# EAGLE schematic RK628H-2x22P-RevA (EAGLE 9.7.0)

## Sheet 1 of 6: Title Page
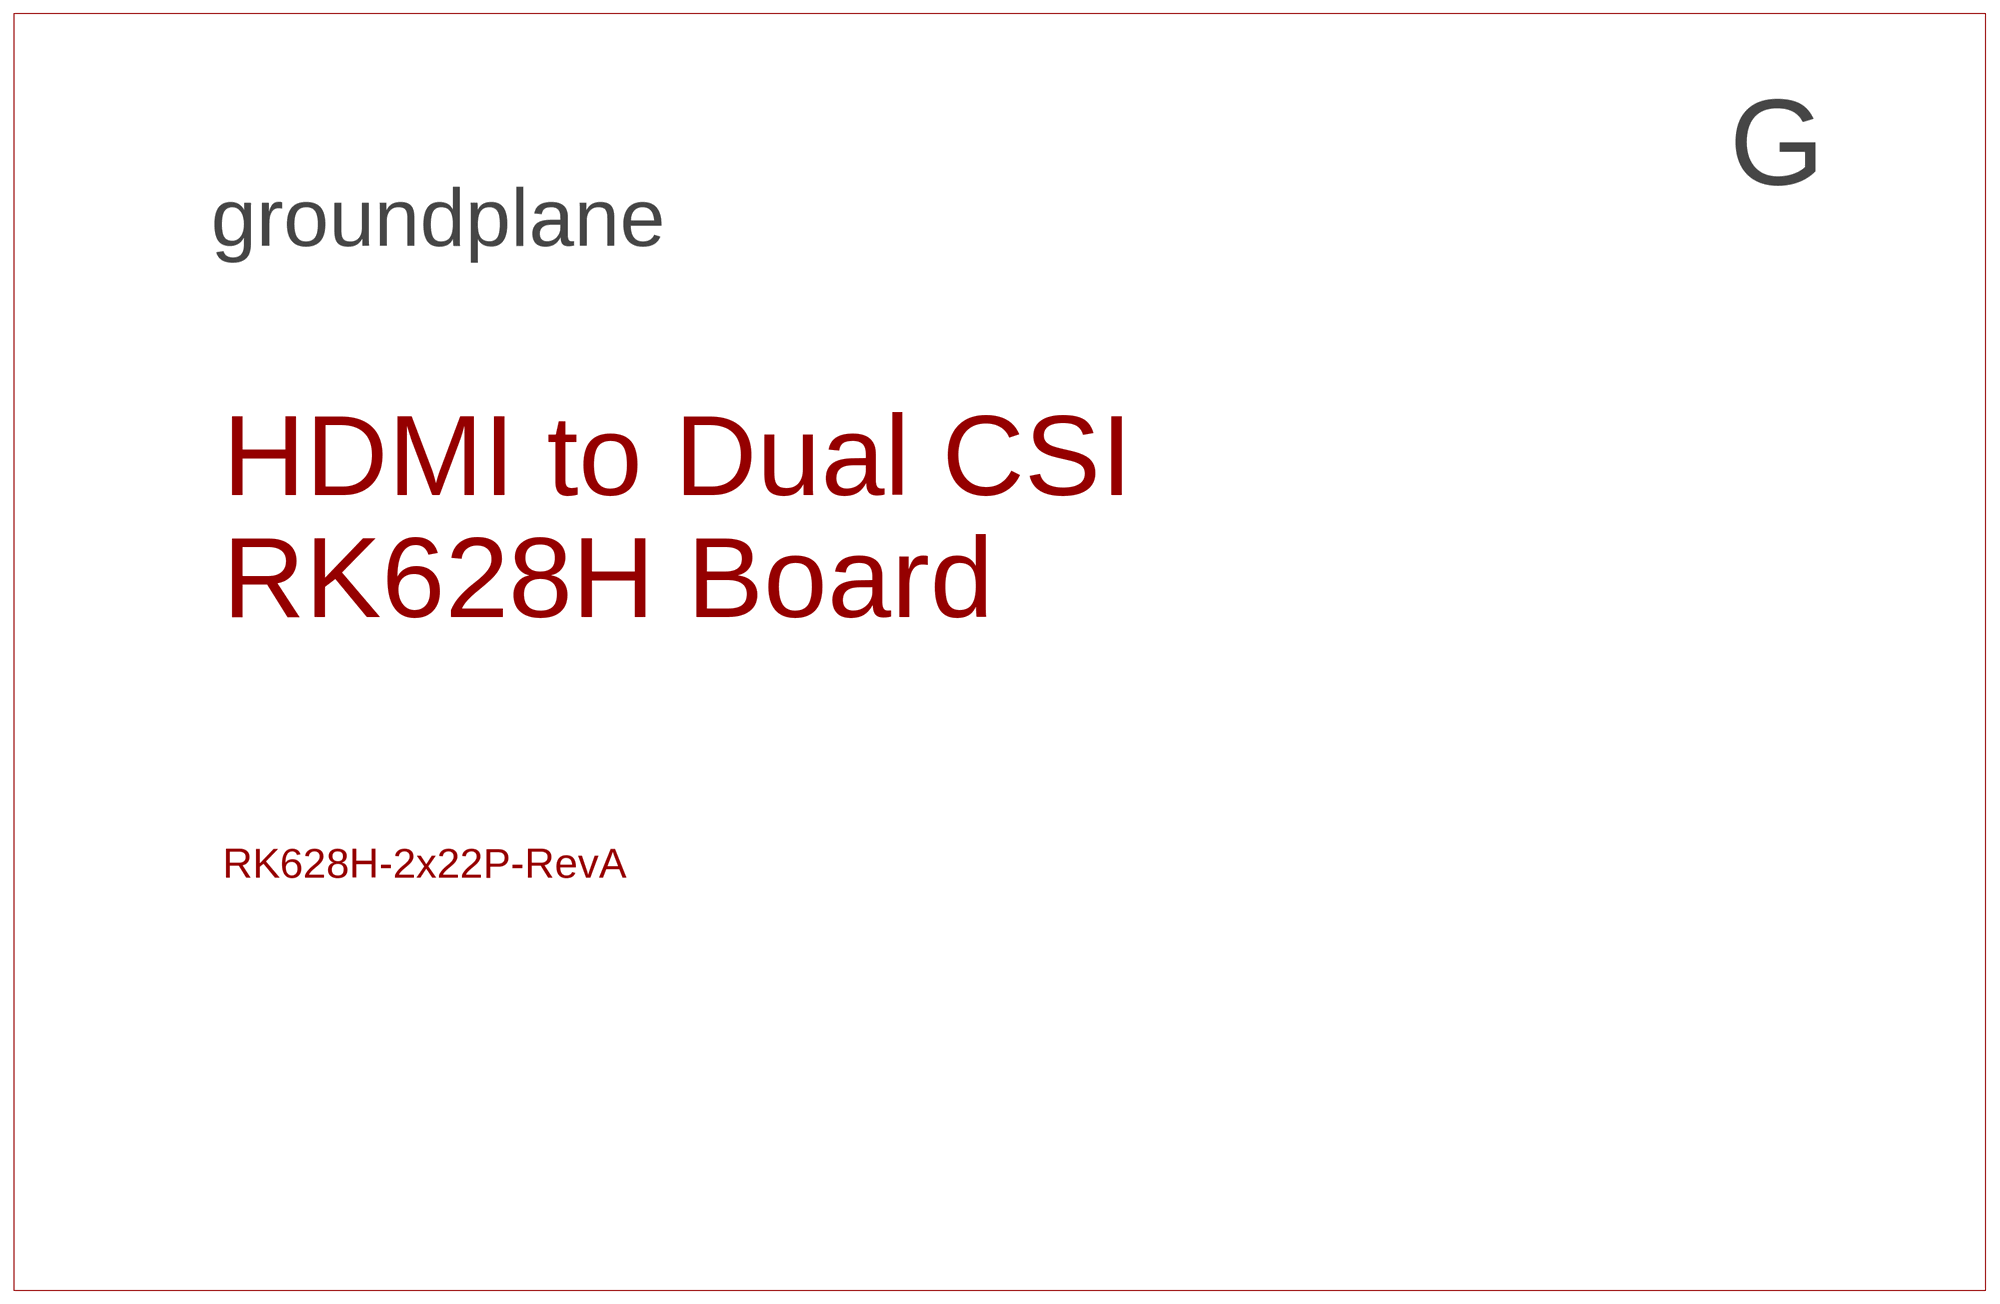
[diagram p0: schematic, sheet 1]

### Notes on the sheet
- HDMI to Dual CSI
  RK628H Board

## Sheet 2 of 6: Table of Contents
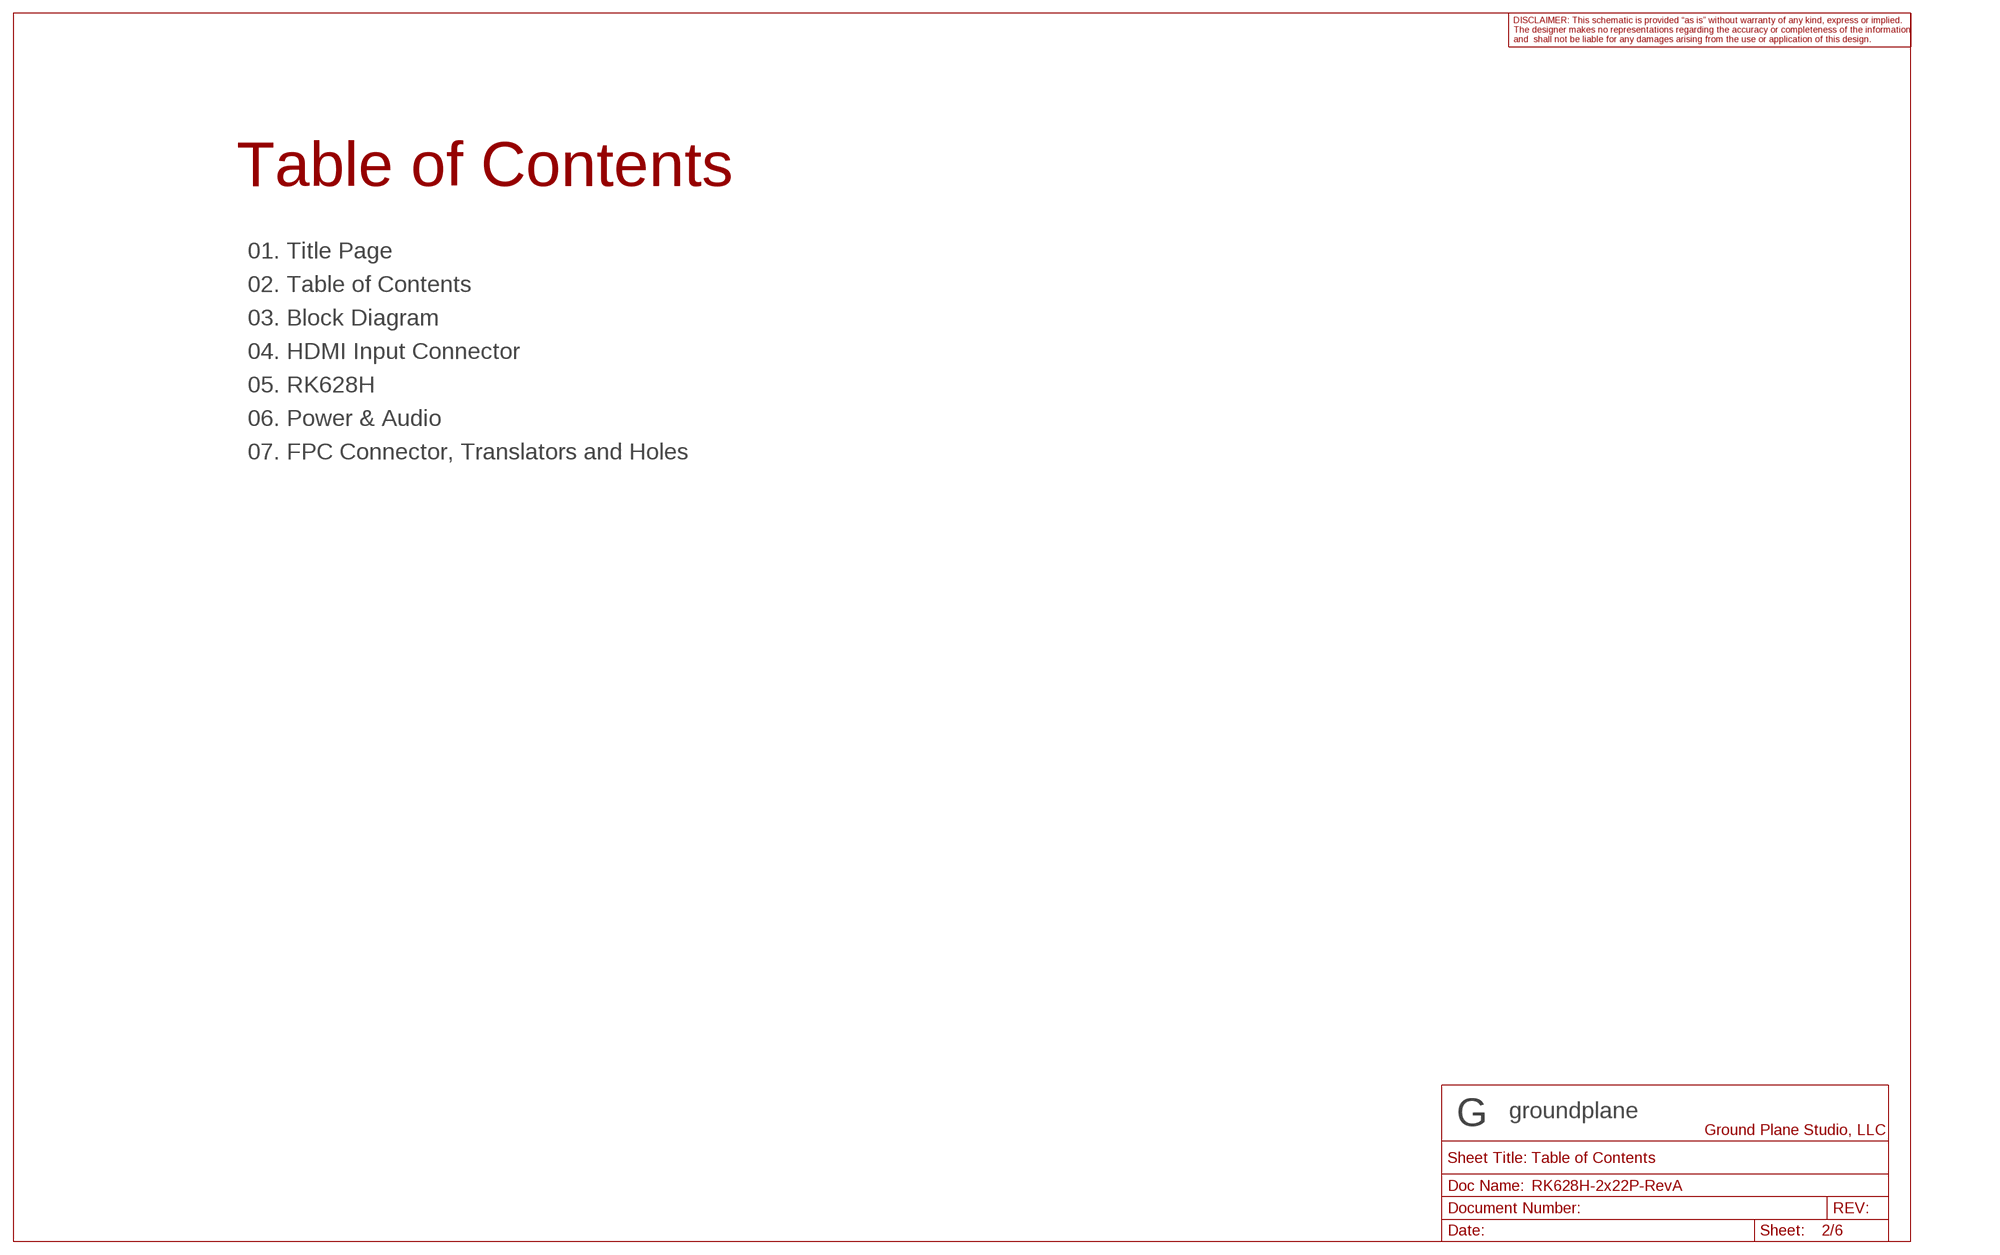
[diagram p1: schematic, sheet 2]

### Notes on the sheet
- 01. Title Page
- 02. Table of Contents
- 03. Block Diagram
- 04. HDMI Input Connector
- 05. RK628H
- 06. Power & Audio
- 07. FPC Connector, Translators and Holes

## Sheet 3 of 6: Block Diagram
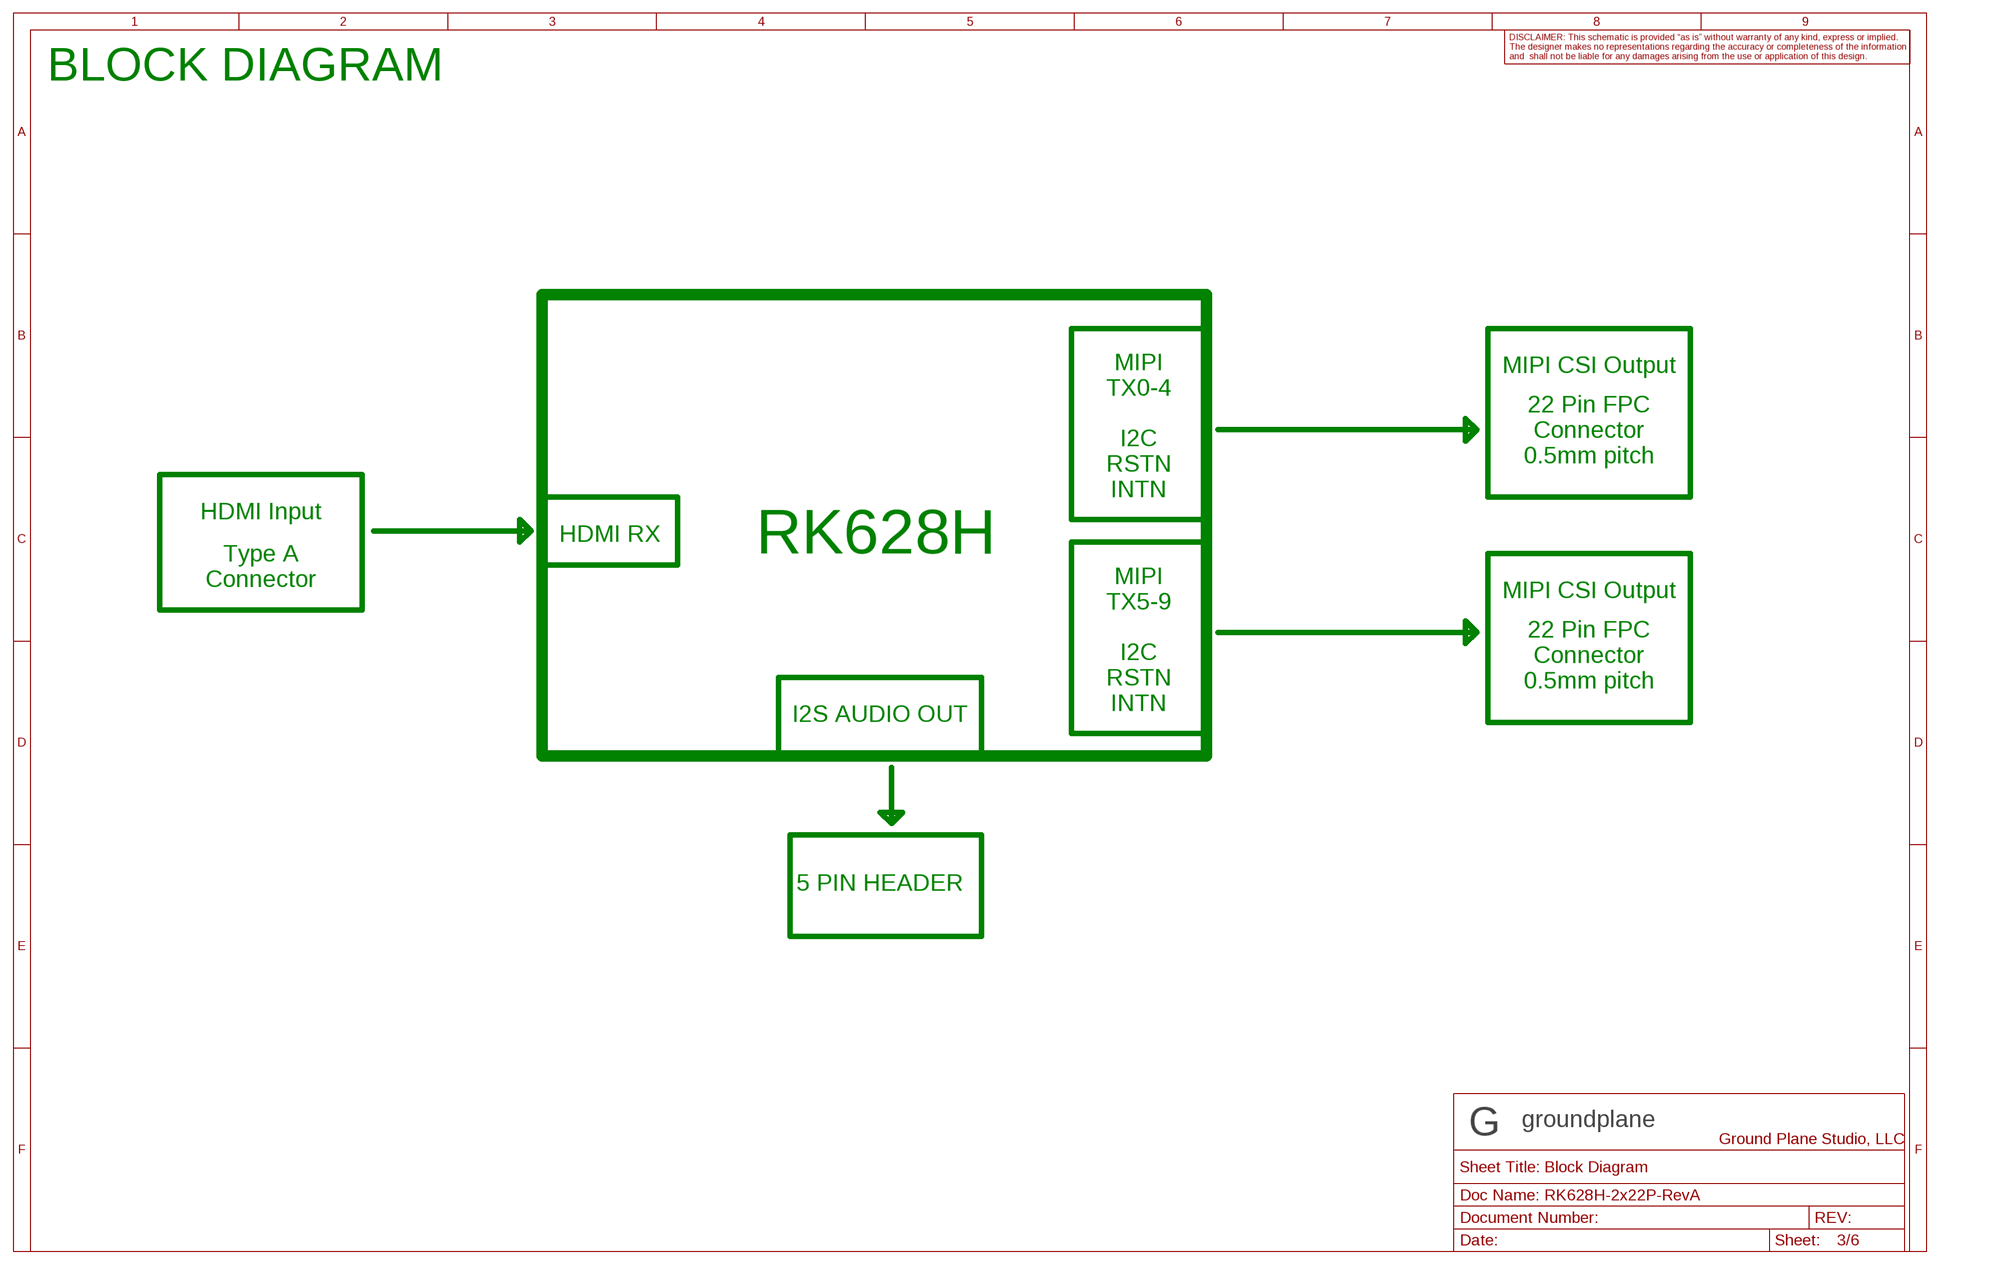
[diagram p2: schematic, sheet 3]

### Notes on the sheet
- BLOCK DIAGRAM
- MIPI CSI Output
- MIPI
  TX0-4
- 22 Pin FPC
  Connector
  0.5mm pitch
- I2C
  RSTN
  INTN
- HDMI Input
- HDMI RX
- RK628H
- Type A
  Connector
- MIPI CSI Output
- MIPI
  TX5-9
- 22 Pin FPC
  Connector
  0.5mm pitch
- I2C
  RSTN
  INTN
- I2S AUDIO OUT
- 5 PIN HEADER

## Sheet 4 of 6: HDMI Input Connector/TVS/Filters
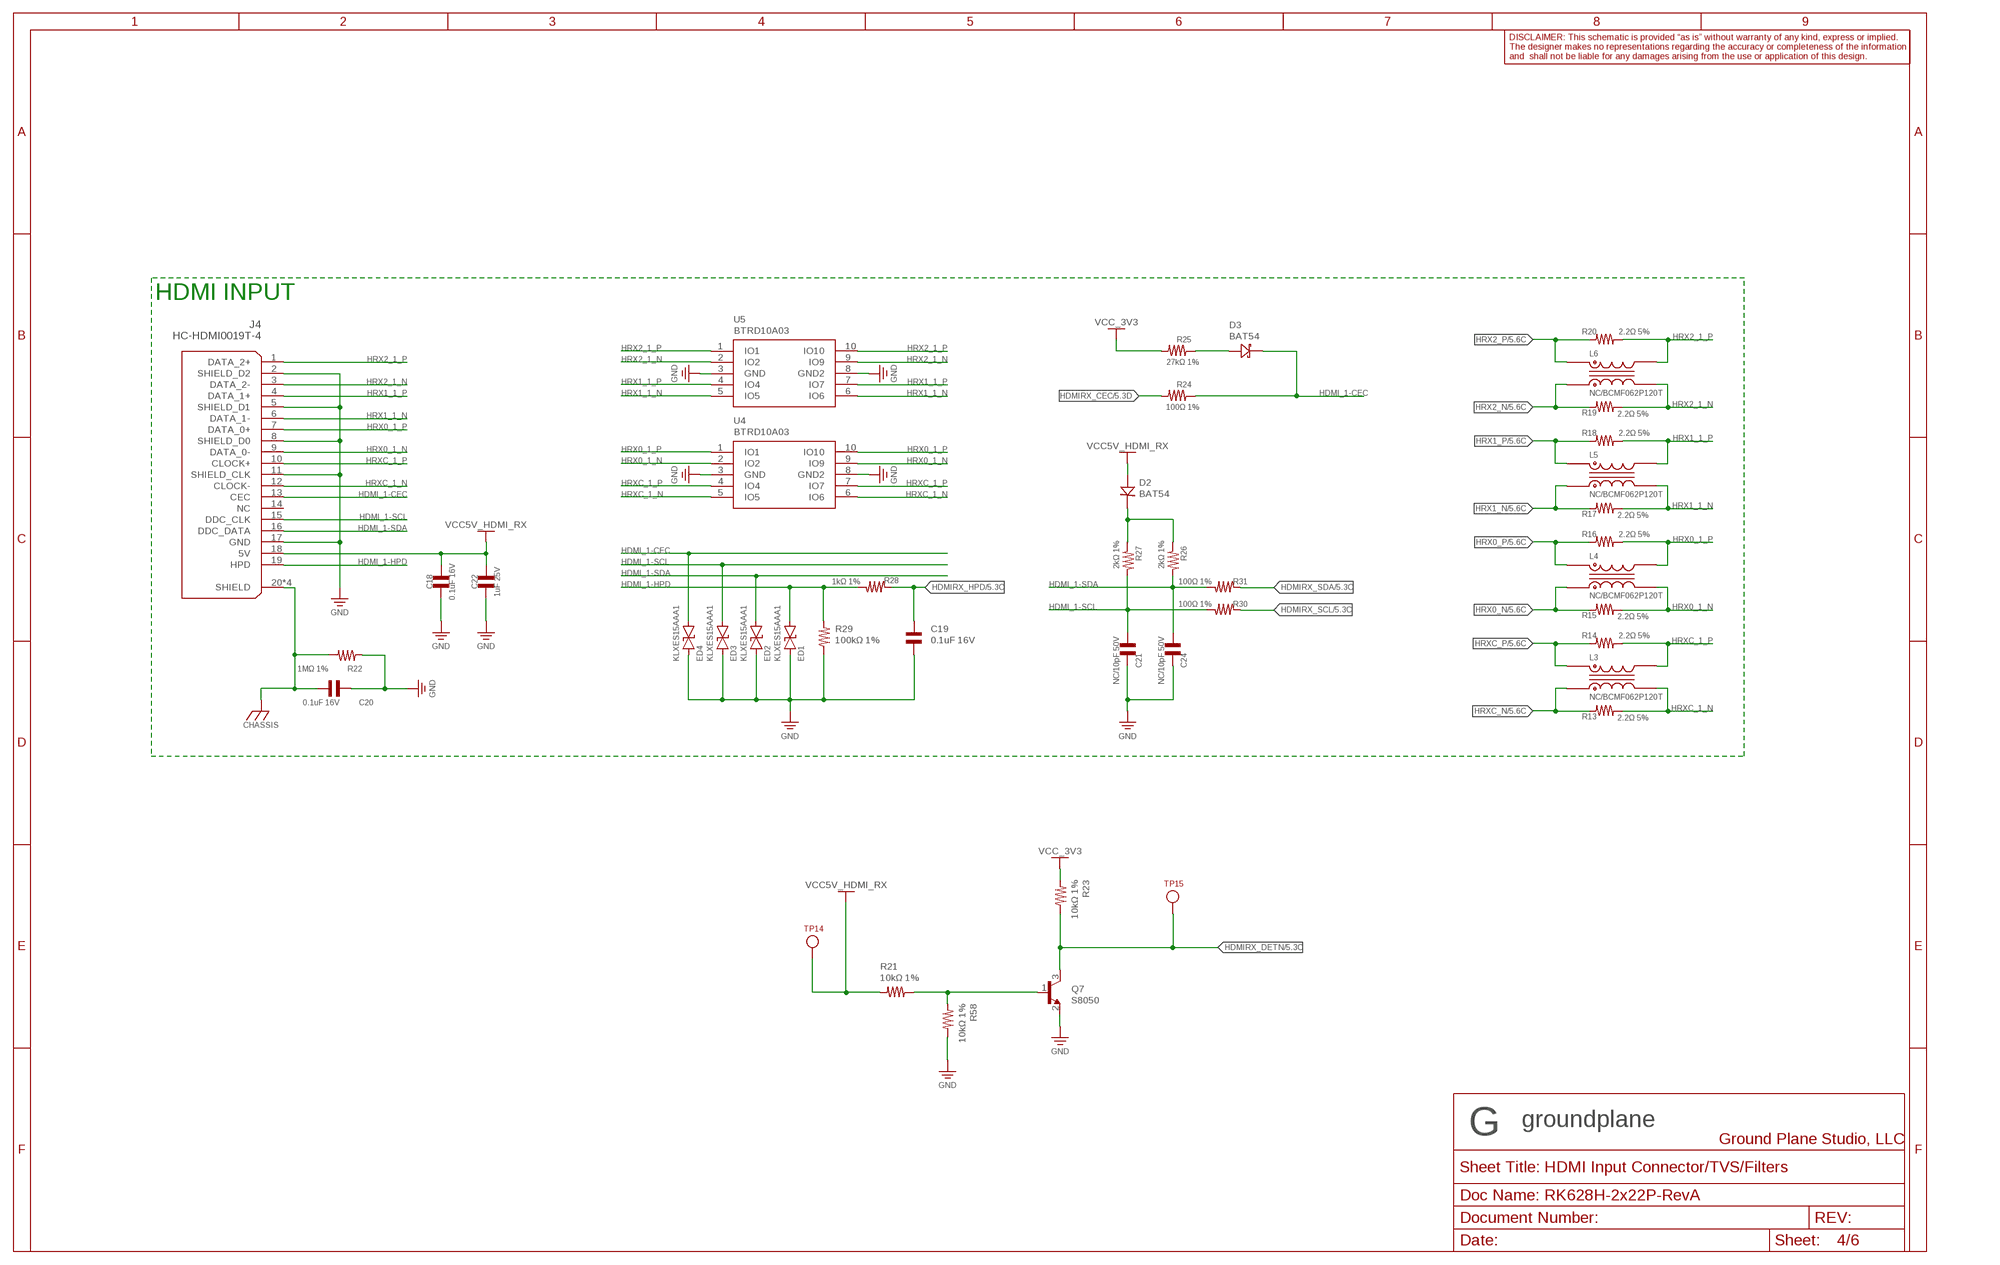
[diagram p3: schematic, sheet 4]

### Parts
C18  0.1uF 16V  CAP_0402_0.1UF_16V_X7R  [CAP_0402]
C19  0.1uF 16V  CAP_0402_0.1UF_16V_X7R  [CAP_0402]
C20  0.1uF 16V  CAP_0402_0.1UF_16V_X7R  [CAP_0402]
C21  NC/10pF 50V  CAP_0201_DNP_10PF_50V  [CAP_0201]
C22  1uF 25V  CAP_0402_1UF_25V_X5R  [CAP_0402]
C24  NC/10pF 50V  CAP_0201_DNP_10PF_50V  [CAP_0201]
D2  BAT54  DIODE_SCHOTTKY_BAT54  [SOT-23-3]
D3  BAT54  DIODE_SCHOTTKY_BAT54  [SOT-23-3]
ED1  KLXES15AAA1  TVS_ESD_1CH_BI_KLXES15AAA1  [TVS_0402]
ED2  KLXES15AAA1  TVS_ESD_1CH_BI_KLXES15AAA1  [TVS_0402]
ED3  KLXES15AAA1  TVS_ESD_1CH_BI_KLXES15AAA1  [TVS_0402]
ED4  KLXES15AAA1  TVS_ESD_1CH_BI_KLXES15AAA1  [TVS_0402]
J4  HC-HDMI0019T-4  CONN_HDMI_A_HC-HDMI0019T-4  [CONN_HDMI_A_SMT_RA_HC-HDMI0019T-4]
L3  NC/BCMF062P120T  BCMF062P120T_BCMF062P120T_NC  [BCMF062P120T]
L4  NC/BCMF062P120T  BCMF062P120T_BCMF062P120T_NC  [BCMF062P120T]
L5  NC/BCMF062P120T  BCMF062P120T_BCMF062P120T_NC  [BCMF062P120T]
L6  NC/BCMF062P120T  BCMF062P120T_BCMF062P120T_NC  [BCMF062P120T]
Q7  S8050  NPN_S8050  [SOT-23-3]
R13  2.2Ω 5%  RES_0201_2R2_5%  [RES_0201]
R14  2.2Ω 5%  RES_0201_2R2_5%  [RES_0201]
R15  2.2Ω 5%  RES_0201_2R2_5%  [RES_0201]
R16  2.2Ω 5%  RES_0201_2R2_5%  [RES_0201]
R17  2.2Ω 5%  RES_0201_2R2_5%  [RES_0201]
R18  2.2Ω 5%  RES_0201_2R2_5%  [RES_0201]
R19  2.2Ω 5%  RES_0201_2R2_5%  [RES_0201]
R20  2.2Ω 5%  RES_0201_2R2_5%  [RES_0201]
R21  10kΩ 1%  RES_0402_10K_1%_1/16W  [RES_0402]
R22  1MΩ 1%  RES_0402_1M_1%  [RES_0402]
R23  10kΩ 1%  RES_0402_10K_1%_1/16W  [RES_0402]
R24  100Ω 1%  RES_0402_100R_1%  [RES_0402]
R25  27kΩ 1%  RES_0402_27K_1%  [RES_0402]
R26  2kΩ 1%  RES_0402_2K_1%_1/16W  [RES_0402]
R27  2kΩ 1%  RES_0402_2K_1%_1/16W  [RES_0402]
R28  1kΩ 1%  RES_0402_1K_1%  [RES_0402]
R29  100kΩ 1%  RES_0402_100K_1%_1/16W  [RES_0402]
R30  100Ω 1%  RES_0402_100R_1%  [RES_0402]
R31  100Ω 1%  RES_0402_100R_1%  [RES_0402]
R58  10kΩ 1%  RES_0402_10K_1%_1/16W  [RES_0402]
TP14  TEST_POINT_1MM_0.5MM  TESTPOINT_1MM  [TEST_POINT_1MM]
TP15  TEST_POINT_1MM_0.5MM  TESTPOINT_1MM  [TEST_POINT_1MM]
U4  BTRD10A03  TVS_ESD_4CH_10P_PASS_THRU_BTRD10A03  [DFN2510-10]
U5  BTRD10A03  TVS_ESD_4CH_10P_PASS_THRU_BTRD10A03  [DFN2510-10]

### Nets
CGND: C20.2 J4.20(SHIELD) J4.21(SHIELD) J4.22(SHIELD) J4.23(SHIELD) R22.1 ; supply symbol labelled CHASSIS ; also sheet 6
GND: C18.1 C19.1 C20.1 C21.1 C22.1 C24.1 ED1.1 ED2.1 ED3.1 ED4.1 J4.2(SHIELD_D2) J4.5(SHIELD_D1) J4.8(SHIELD_D0) J4.11(SHIELD_CLK) J4.17(GND) Q7.2(E) R22.2 R29.1 R58.1 U4.3(GND) U4.8(GND2) U5.3(GND) U5.8(GND2) ; also sheet 5,6
HDMI_1-CEC: D3.3(C) ED4.2 J4.13(CEC) R24.1
HDMI_1-HPD: ED1.2 J4.19(HPD) R28.1 R29.2
HDMI_1-SCL: C21.2 ED3.2 J4.15(DDC_CLK) R27.2 R30.1
HDMI_1-SDA: C24.2 ED2.2 J4.16(DDC_DATA) R26.2 R31.1
HDMIRX_CEC [50 ohm]: R24.2 ; also sheet 5
HDMIRX_DETN: Q7.3(C) R23.1 TP15.P$1 ; also sheet 5,6
HDMIRX_HPD: C19.2 R28.2 ; also sheet 5
HDMIRX_SCL [50 ohm]: R30.2 ; also sheet 5
HDMIRX_SDA [50 ohm]: R31.2 ; also sheet 5
HRX0_1_N [hdmi_diff]: J4.9(DATA_0-) L4.3 R15.1 U4.2(IO2) U4.9(IO9)
HRX0_1_P [hdmi_diff]: J4.7(DATA_0+) L4.4 R16.1 U4.1(IO1) U4.10(IO10)
HRX0_N [hdmi_diff]: L4.2 R15.2 ; also sheet 5
HRX0_P [hdmi_diff]: L4.1 R16.2 ; also sheet 5
HRX1_1_N [hdmi_diff]: J4.6(DATA_1-) L5.3 R17.1 U5.5(IO5) U5.6(IO6)
HRX1_1_P [hdmi_diff]: J4.4(DATA_1+) L5.4 R18.1 U5.4(IO4) U5.7(IO7)
HRX1_N [hdmi_diff]: L5.2 R17.2 ; also sheet 5
HRX1_P [hdmi_diff]: L5.1 R18.2 ; also sheet 5
HRX2_1_N [hdmi_diff]: J4.3(DATA_2-) L6.3 R19.1 U5.2(IO2) U5.9(IO9)
HRX2_1_P [hdmi_diff]: J4.1(DATA_2+) L6.4 R20.1 U5.1(IO1) U5.10(IO10)
HRX2_N [hdmi_diff]: L6.2 R19.2 ; also sheet 5
HRX2_P [hdmi_diff]: L6.1 R20.2 ; also sheet 5
HRXC_1_N [hdmi_diff]: J4.12(CLOCK-) L3.3 R13.1 U4.5(IO5) U4.6(IO6)
HRXC_1_P [hdmi_diff]: J4.10(CLOCK+) L3.4 R14.1 U4.4(IO4) U4.7(IO7)
HRXC_N [hdmi_diff]: L3.2 R13.2 ; also sheet 5
HRXC_P [hdmi_diff]: L3.1 R14.2 ; also sheet 5
N$1: D2.3(C) R26.1 R27.1
N$11: D3.1(A) R25.1
N$44: Q7.1(B) R21.1 R58.2
VCC5V_HDMI_RX: C18.2 C22.2 D2.1(A) J4.18(5V) R21.2 TP14.P$1
VCC_3V3: R23.2 R25.2 ; also sheet 5,6
Unconnected: J4.14(NC)

### Notes on the sheet
- HDMI INPUT

## Sheet 5 of 6: HDMI TO CSI - RK628H
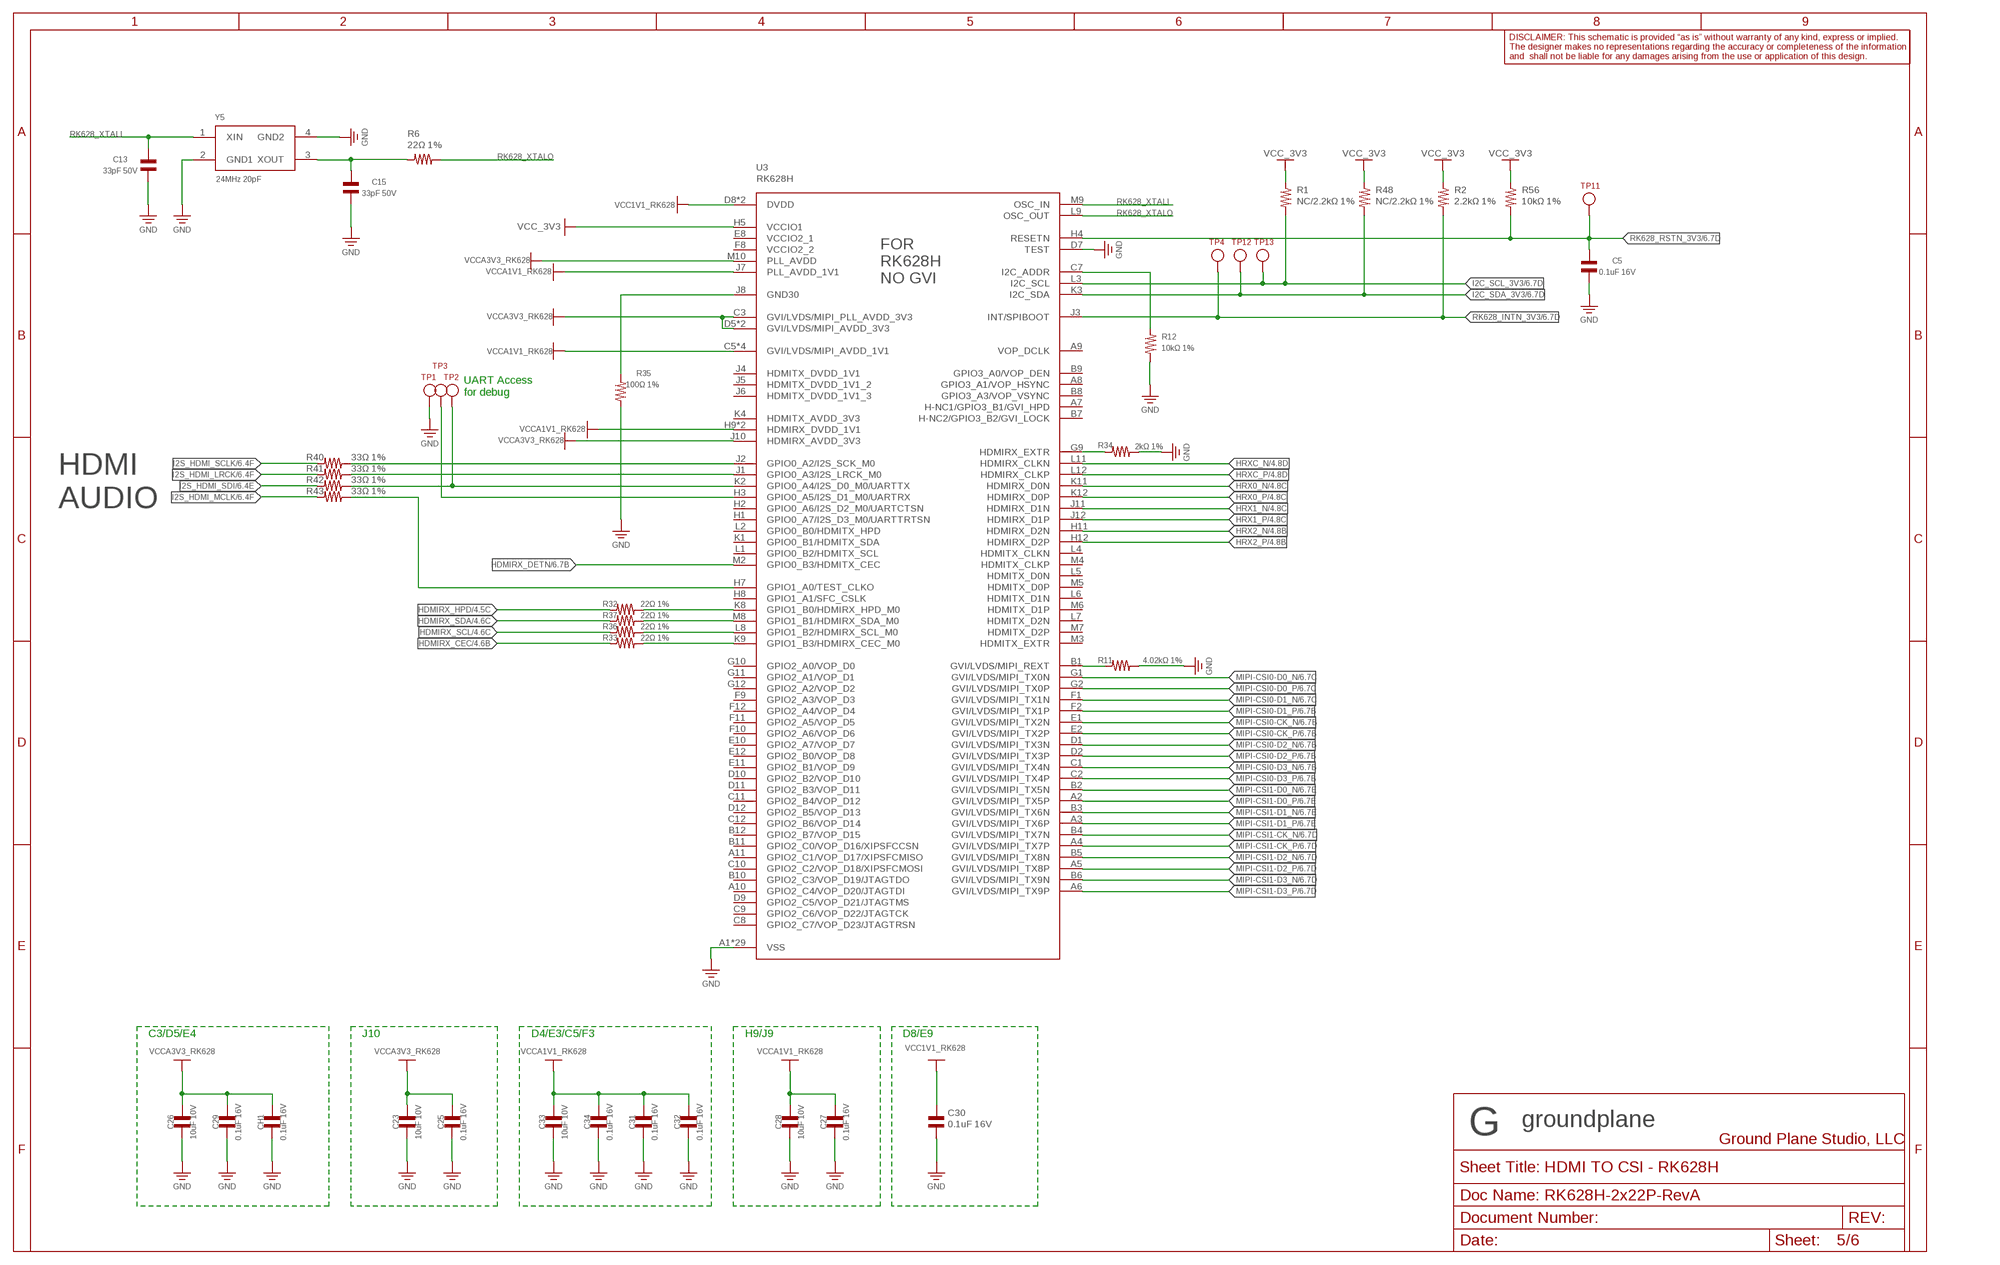
[diagram p4: schematic, sheet 5]

### Parts
C5  0.1uF 16V  CAP_0402_0.1UF_16V_X7R  [CAP_0402]
C13  33pF 50V  CAP_0402_33PF_50V  [CAP_0402]
C15  33pF 50V  CAP_0402_33PF_50V  [CAP_0402]
C23  10uF 10V  CAP_0402_10UF_10V_X5R  [CAP_0402]
C25  0.1uF 16V  CAP_0402_0.1UF_16V_X7R  [CAP_0402]
C26  10uF 10V  CAP_0402_10UF_10V_X5R  [CAP_0402]
C27  0.1uF 16V  CAP_0402_0.1UF_16V_X7R  [CAP_0402]
C28  10uF 10V  CAP_0402_10UF_10V_X5R  [CAP_0402]
C29  0.1uF 16V  CAP_0402_0.1UF_16V_X7R  [CAP_0402]
C30  0.1uF 16V  CAP_0402_0.1UF_16V_X7R  [CAP_0402]
C31  0.1uF 16V  CAP_0402_0.1UF_16V_X7R  [CAP_0402]
C32  0.1uF 16V  CAP_0402_0.1UF_16V_X7R  [CAP_0402]
C33  10uF 10V  CAP_0402_10UF_10V_X5R  [CAP_0402]
C34  0.1uF 16V  CAP_0402_0.1UF_16V_X7R  [CAP_0402]
CH1  0.1uF 16V  CAP_0402_0.1UF_16V_X7R  [CAP_0402]
R1  NC/2.2kΩ 1%  RES_0402_DNP_2K2_1%  [RES_0402]
R2  2.2kΩ 1%  RES_0402_2K2_1%  [RES_0402]
R6  22Ω 1%  RES_0402_22R_1%  [RES_0402]
R11  4.02kΩ 1%  RES_0402_4K02_1%  [RES_0402]
R12  10kΩ 1%  RES_0402_10K_1%_1/16W  [RES_0402]
R32  22Ω 1%  RES_0402_22R_1%  [RES_0402]
R33  22Ω 1%  RES_0402_22R_1%  [RES_0402]
R34  2kΩ 1%  RES_0402_2K_1%_1/16W  [RES_0402]
R35  100Ω 1%  RES_0402_100R_1%  [RES_0402]
R36  22Ω 1%  RES_0402_22R_1%  [RES_0402]
R37  22Ω 1%  RES_0402_22R_1%  [RES_0402]
R40  33Ω 1%  RES_0402_33R_1%  [RES_0402]
R41  33Ω 1%  RES_0402_33R_1%  [RES_0402]
R42  33Ω 1%  RES_0402_33R_1%  [RES_0402]
R43  33Ω 1%  RES_0402_33R_1%  [RES_0402]
R48  NC/2.2kΩ 1%  RES_0402_DNP_2K2_1%  [RES_0402]
R56  10kΩ 1%  RES_0402_10K_1%_1/16W  [RES_0402]
TP1  TESTPOINT_1MM  [TEST_POINT_1MM]
TP2  TESTPOINT_1MM  [TEST_POINT_1MM]
TP3  TESTPOINT_1MM  [TEST_POINT_1MM]
TP4  TEST_POINT_1MM_0.5MM  TESTPOINT_1MM  [TEST_POINT_1MM]
TP11  TESTPOINT_1MM  [TEST_POINT_1MM]
TP12  TEST_POINT_1MM_0.5MM  TESTPOINT_1MM  [TEST_POINT_1MM]
TP13  TEST_POINT_1MM_0.5MM  TESTPOINT_1MM  [TEST_POINT_1MM]
U3  RK628H  IF_VIDEO_BRIDGE_RK628F/H_RK628H  [WBBGA144_8X8MM]
Y5  24MHz 20pF  CRYSTAL_SMD2016-4P_24MHZ_20PF_10PPM_T201624MLBDE2X  [CRYSTAL_SMD2016-4P]

### Nets
GND: C5.1 C13.1 C15.1 C23.1 C25.1 C26.1 C27.1 C28.1 C29.1 C30.2 C31.1 C32.1 C33.1 C34.1 CH1.1 R11.1 R12.1 R34.1 R35.2 TP1.P$1 U3.A1(VSS) U3.A12(VSS) U3.C4(VSS) U3.C6(VSS) U3.D3(VSS) U3.D6(VSS) U3.D7(TEST) U3.E5(VSS) U3.E6(VSS) U3.E7(VSS) U3.F4(VSS) U3.F5(VSS) U3.F6(VSS) U3.F7(VSS) U3.G3(VSS) U3.G4(VSS) U3.G5(VSS) U3.G6(VSS) U3.G7(VSS) U3.G8(VSS) U3.H6(VSS) U3.H10(VSS) U3.K5(VSS) U3.K6(VSS) U3.K7(VSS) U3.K10(VSS) U3.L10(VSS) U3.M1(VSS) U3.M11(VSS) U3.M12(VSS) Y5.2(GND1) Y5.4(GND2) ; also sheet 4,6
HDMIRX_CEC [50 ohm]: R33.2 ; also sheet 4
HDMIRX_DETN: U3.M2(GPIO0_B3/HDMITX_CEC) ; also sheet 4,6
HDMIRX_HPD: R32.2 ; also sheet 4
HDMIRX_SCL [50 ohm]: R36.2 ; also sheet 4
HDMIRX_SDA [50 ohm]: R37.2 ; also sheet 4
HRX0_N [hdmi_diff]: U3.K11(HDMIRX_D0N) ; also sheet 4
HRX0_P [hdmi_diff]: U3.K12(HDMIRX_D0P) ; also sheet 4
HRX1_N [hdmi_diff]: U3.J11(HDMIRX_D1N) ; also sheet 4
HRX1_P [hdmi_diff]: U3.J12(HDMIRX_D1P) ; also sheet 4
HRX2_N [hdmi_diff]: U3.H11(HDMIRX_D2N) ; also sheet 4
HRX2_P [hdmi_diff]: U3.H12(HDMIRX_D2P) ; also sheet 4
HRXC_N [hdmi_diff]: U3.L11(HDMIRX_CLKN) ; also sheet 4
HRXC_P [hdmi_diff]: U3.L12(HDMIRX_CLKP) ; also sheet 4
I2C_SCL_3V3: R1.1 TP13.P$1 U3.L3(I2C_SCL) ; also sheet 6
I2C_SDA_3V3: R48.1 TP12.P$1 U3.K3(I2C_SDA) ; also sheet 6
I2S_HDMI_LRCK [50 ohm]: R41.2 ; also sheet 6
I2S_HDMI_MCLK [50 ohm]: R43.2 ; also sheet 6
I2S_HDMI_SCLK [50 ohm]: R40.2 ; also sheet 6
I2S_HDMI_SDI [50 ohm]: R42.2 ; also sheet 6
MIPI-CSI0-CK_N [hdmi_diff]: U3.E1(GVI/LVDS/MIPI_TX2N) ; also sheet 6
MIPI-CSI0-CK_P [hdmi_diff]: U3.E2(GVI/LVDS/MIPI_TX2P) ; also sheet 6
MIPI-CSI0-D0_N [hdmi_diff]: U3.G1(GVI/LVDS/MIPI_TX0N) ; also sheet 6
MIPI-CSI0-D0_P [hdmi_diff]: U3.G2(GVI/LVDS/MIPI_TX0P) ; also sheet 6
MIPI-CSI0-D1_N [hdmi_diff]: U3.F1(GVI/LVDS/MIPI_TX1N) ; also sheet 6
MIPI-CSI0-D1_P [hdmi_diff]: U3.F2(GVI/LVDS/MIPI_TX1P) ; also sheet 6
MIPI-CSI0-D2_N [hdmi_diff]: U3.D1(GVI/LVDS/MIPI_TX3N) ; also sheet 6
MIPI-CSI0-D2_P [hdmi_diff]: U3.D2(GVI/LVDS/MIPI_TX3P) ; also sheet 6
MIPI-CSI0-D3_N [hdmi_diff]: U3.C1(GVI/LVDS/MIPI_TX4N) ; also sheet 6
MIPI-CSI0-D3_P [hdmi_diff]: U3.C2(GVI/LVDS/MIPI_TX4P) ; also sheet 6
MIPI-CSI1-CK_N [hdmi_diff]: U3.B4(GVI/LVDS/MIPI_TX7N) ; also sheet 6
MIPI-CSI1-CK_P [hdmi_diff]: U3.A4(GVI/LVDS/MIPI_TX7P) ; also sheet 6
MIPI-CSI1-D0_N [hdmi_diff]: U3.B2(GVI/LVDS/MIPI_TX5N) ; also sheet 6
MIPI-CSI1-D0_P [hdmi_diff]: U3.A2(GVI/LVDS/MIPI_TX5P) ; also sheet 6
MIPI-CSI1-D1_N [hdmi_diff]: U3.B3(GVI/LVDS/MIPI_TX6N) ; also sheet 6
MIPI-CSI1-D1_P [hdmi_diff]: U3.A3(GVI/LVDS/MIPI_TX6P) ; also sheet 6
MIPI-CSI1-D2_N [hdmi_diff]: U3.B5(GVI/LVDS/MIPI_TX8N) ; also sheet 6
MIPI-CSI1-D2_P [hdmi_diff]: U3.A5(GVI/LVDS/MIPI_TX8P) ; also sheet 6
MIPI-CSI1-D3_N [hdmi_diff]: U3.B6(GVI/LVDS/MIPI_TX9N) ; also sheet 6
MIPI-CSI1-D3_P [hdmi_diff]: U3.A6(GVI/LVDS/MIPI_TX9P) ; also sheet 6
N$2: C15.2 R6.2 Y5.3(XOUT)
N$15 [50 ohm]: R40.1 U3.J2(GPIO0_A2/I2S_SCK_M0)
N$16 [50 ohm]: R41.1 U3.J1(GPIO0_A3/I2S_LRCK_M0)
N$18 [50 ohm]: R42.1 TP2.P$1 U3.K2(GPIO0_A4/I2S_D0_M0/UARTTX)
N$22 [50 ohm]: R43.1 U3.H7(GPIO1_A0/TEST_CLKO)
N$24: R11.2 U3.B1(GVI/LVDS/MIPI_REXT)
N$25: R34.2 U3.G9(HDMIRX_EXTR)
N$94: R32.1 U3.K8(GPIO1_B0/HDMIRX_HPD_M0)
N$95: R37.1 U3.M8(GPIO1_B1/HDMIRX_SDA_M0)
N$96: R36.1 U3.L8(GPIO1_B2/HDMIRX_SCL_M0)
N$97: R33.1 U3.K9(GPIO1_B3/HDMIRX_CEC_M0)
N$99: R35.1 U3.J8(GND30)
N$108: TP3.P$1 U3.H3(GPIO0_A5/I2S_D1_M0/UARTRX)
N$110: R12.2 U3.C7(I2C_ADDR)
RK628_INTN_3V3: R2.1 TP4.P$1 U3.J3(INT/SPIBOOT) ; also sheet 6
RK628_RSTN_3V3: C5.2 R56.1 TP11.P$1 U3.H4(RESETN) ; also sheet 6
RK628_XTALI: C13.2 U3.M9(OSC_IN) Y5.1(XIN)
RK628_XTALO: R6.1 U3.L9(OSC_OUT)
VCC1V1_RK628: C30.1 U3.D8(DVDD) U3.E9(DVDD) ; also sheet 6
VCC_3V3: R1.2 R2.2 R48.2 R56.2 U3.H5(VCCIO1) ; also sheet 4,6
VCCA1V1_RK628: C27.2 C28.2 C31.2 C32.2 C33.2 C34.2 U3.C5(GVI/LVDS/MIPI_AVDD_1V1) U3.D4(GVI/LVDS/MIPI_AVDD_1V1) U3.E3(GVI/LVDS/MIPI_AVDD_1V1) U3.F3(GVI/LVDS/MIPI_AVDD_1V1) U3.H9(HDMIRX_DVDD_1V1) U3.J7(PLL_AVDD_1V1) U3.J9(HDMIRX_DVDD_1V1) ; also sheet 6
VCCA3V3_RK628: C23.2 C25.2 C26.2 C29.2 CH1.2 U3.C3(GVI/LVDS/MIPI_PLL_AVDD_3V3) U3.D5(GVI/LVDS/MIPI_AVDD_3V3) U3.E4(GVI/LVDS/MIPI_AVDD_3V3) U3.J10(HDMIRX_AVDD_3V3) U3.M10(PLL_AVDD) ; also sheet 6
Unconnected: U3.A7(H-NC1/GPIO3_B1/GVI_HPD) U3.A8(GPIO3_A1/VOP_HSYNC) U3.A9(VOP_DCLK) U3.A10(GPIO2_C4/VOP_D20/JTAGTDI) U3.A11(GPIO2_C1/VOP_D17/XIPSFCMISO) U3.B7(H-NC2/GPIO3_B2/GVI_LOCK) U3.B8(GPIO3_A3/VOP_VSYNC) U3.B9(GPIO3_A0/VOP_DEN) U3.B10(GPIO2_C3/VOP_D19/JTAGTDO) U3.B11(GPIO2_C0/VOP_D16/XIPSFCCSN) U3.B12(GPIO2_B7/VOP_D15) U3.C8(GPIO2_C7/VOP_D23/JTAGTRSN) U3.C9(GPIO2_C6/VOP_D22/JTAGTCK) U3.C10(GPIO2_C2/VOP_D18/XIPSFCMOSI) U3.C11(GPIO2_B4/VOP_D12) U3.C12(GPIO2_B6/VOP_D14) U3.D9(GPIO2_C5/VOP_D21/JTAGTMS) U3.D10(GPIO2_B2/VOP_D10) U3.D11(GPIO2_B3/VOP_D11) U3.D12(GPIO2_B5/VOP_D13) U3.E10(GPIO2_A7/VOP_D7) U3.E11(GPIO2_B1/VOP_D9) U3.E12(GPIO2_B0/VOP_D8) U3.F9(GPIO2_A3/VOP_D3) U3.F10(GPIO2_A6/VOP_D6) U3.F11(GPIO2_A5/VOP_D5) U3.F12(GPIO2_A4/VOP_D4) U3.G10(GPIO2_A0/VOP_D0) U3.G11(GPIO2_A1/VOP_D1) U3.G12(GPIO2_A2/VOP_D2) U3.H1(GPIO0_A7/I2S_D3_M0/UARTTRTSN) U3.H2(GPIO0_A6/I2S_D2_M0/UARTCTSN) U3.H8(GPIO1_A1/SFC_CSLK) U3.K1(GPIO0_B1/HDMITX_SDA) U3.L1(GPIO0_B2/HDMITX_SCL) U3.L2(GPIO0_B0/HDMITX_HPD) U3.L4(HDMITX_CLKN) U3.L5(HDMITX_D0N) U3.L6(HDMITX_D1N) U3.L7(HDMITX_D2N) U3.M3(HDMITX_EXTR) U3.M4(HDMITX_CLKP) U3.M5(HDMITX_D0P) U3.M6(HDMITX_D1P) U3.M7(HDMITX_D2P)

### Notes on the sheet
- UART Access
  for debug
- HDMI 
  AUDIO
- C3/D5/E4 | J10 | D4/E3/C5/F3 | H9/J9 | D8/E9

## Sheet 6 of 6: Power & Audio
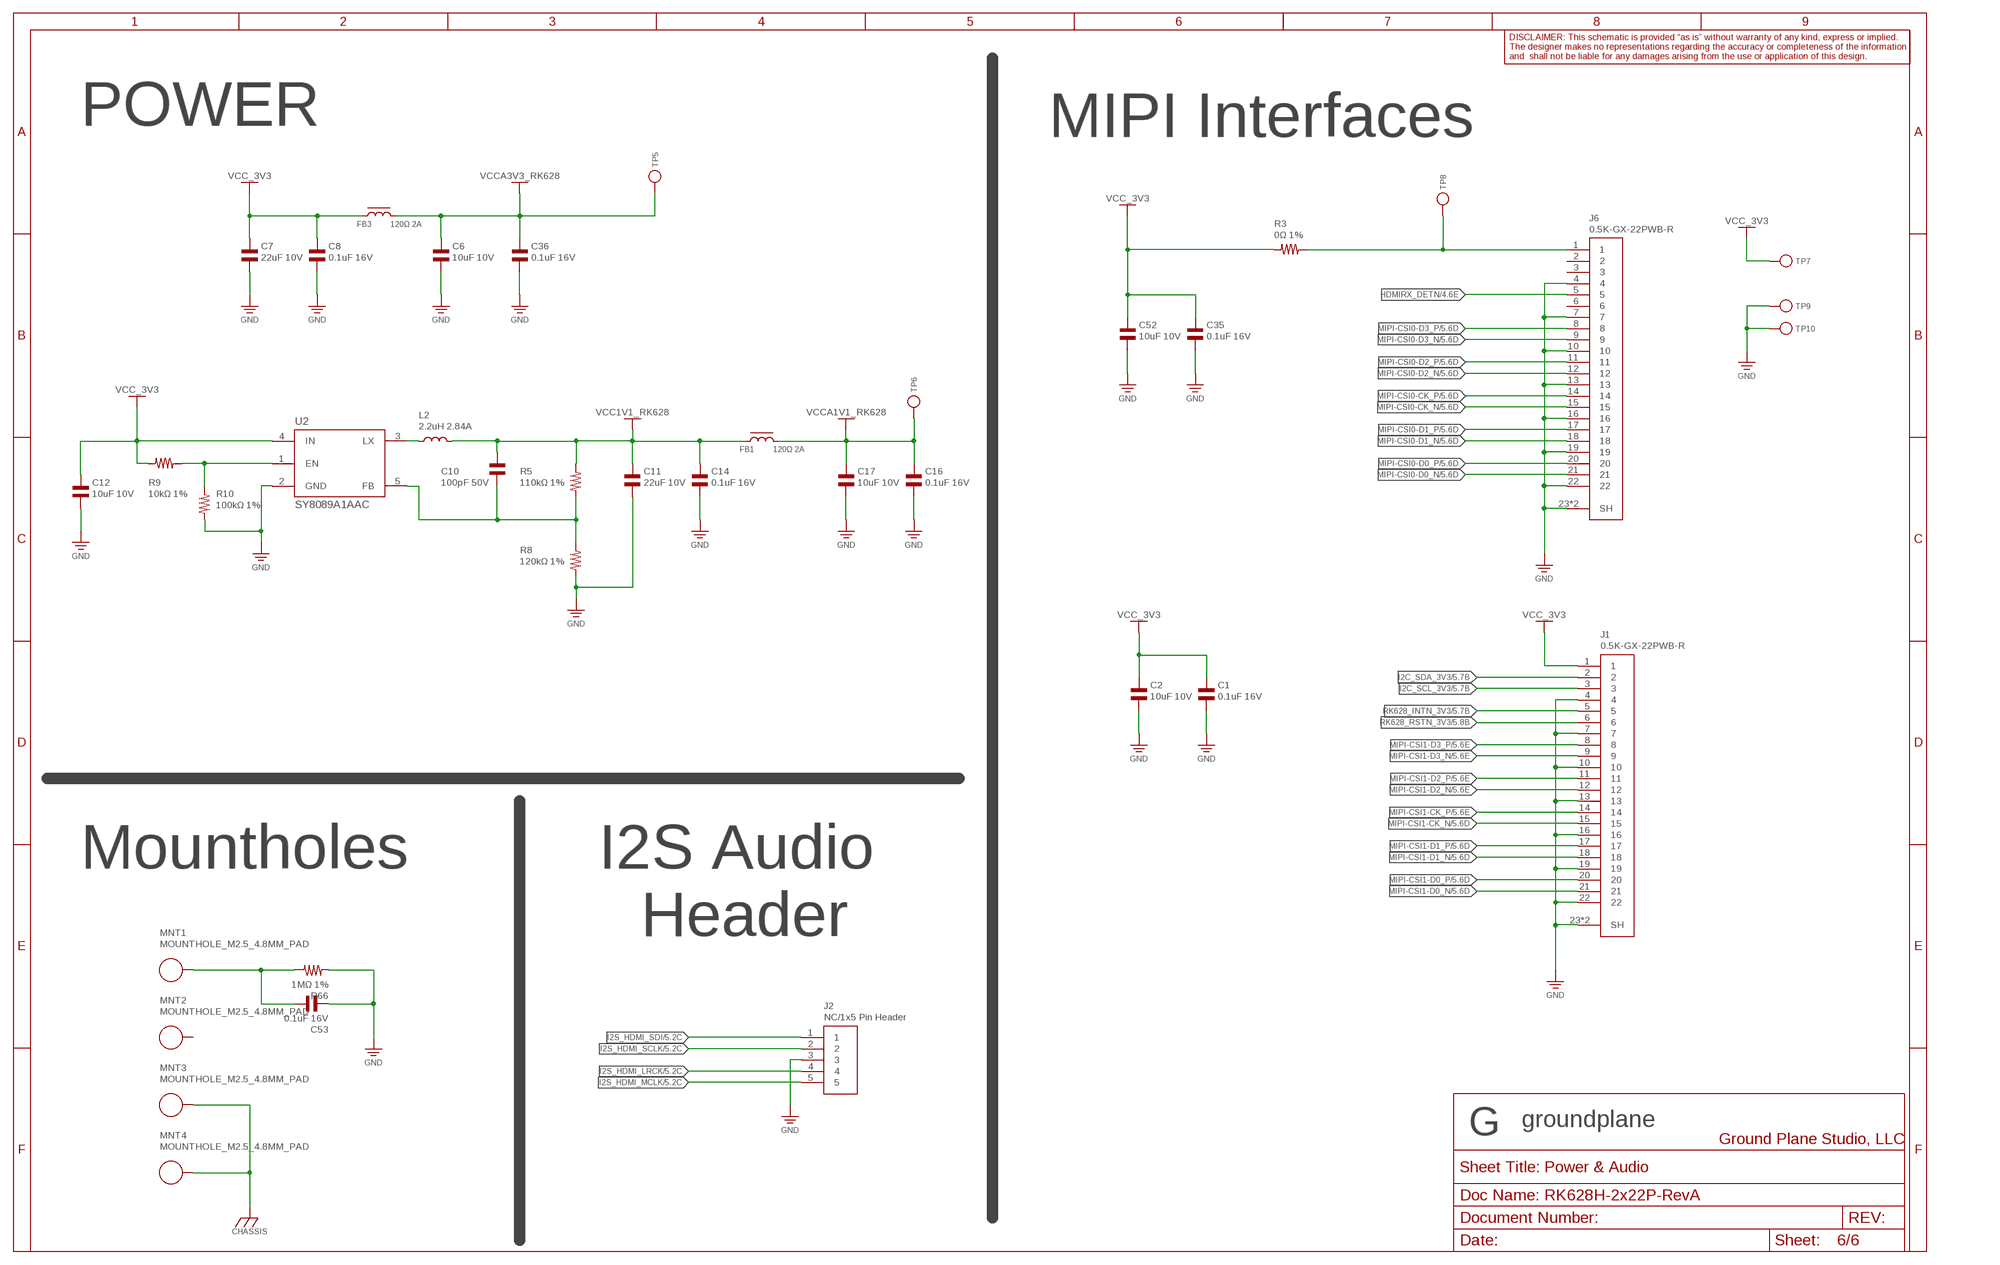
[diagram p5: schematic, sheet 6]

### Parts
C1  0.1uF 16V  CAP_0402_0.1UF_16V_X7R  [CAP_0402]
C2  10uF 10V  CAP_0402_10UF_10V_X5R  [CAP_0402]
C6  10uF 10V  CAP_0402_10UF_10V_X5R  [CAP_0402]
C7  22uF 10V  CAP_0603_22UF_10V_X5R  [CAP_0603]
C8  0.1uF 16V  CAP_0402_0.1UF_16V_X7R  [CAP_0402]
C10  100pF 50V  CAP_0402_100PF_50V_NP0  [CAP_0402]
C11  22uF 10V  CAP_0603_22UF_10V_X5R  [CAP_0603]
C12  10uF 10V  CAP_0402_10UF_10V_X5R  [CAP_0402]
C14  0.1uF 16V  CAP_0402_0.1UF_16V_X7R  [CAP_0402]
C16  0.1uF 16V  CAP_0402_0.1UF_16V_X7R  [CAP_0402]
C17  10uF 10V  CAP_0402_10UF_10V_X5R  [CAP_0402]
C35  0.1uF 16V  CAP_0402_0.1UF_16V_X7R  [CAP_0402]
C36  0.1uF 16V  CAP_0402_0.1UF_16V_X7R  [CAP_0402]
C52  10uF 10V  CAP_0402_10UF_10V_X5R  [CAP_0402]
C53  0.1uF 16V  CAP_0402_0.1UF_16V_X7R  [CAP_0402]
FB1  120Ω 2A  FERRITE_0603_120R_2A  [IND_0603]
FB3  120Ω 2A  FERRITE_0603_120R_2A  [IND_0603]
J1  0.5K-GX-22PWB-R  CONN_FFC_1X22_SH_0.5MM_SM_RA_0.5K-GX-22PWB-R  [CONN_FFC_1X22_0.5MM_SM_RA_0.5K-GX-22PWB-R]
J2  NC/1x5 Pin Header  HDR_1X05_DNP_2.54MM_TH_ST  [HDR_1X05_2.54MM_TH_ST]
J6  0.5K-GX-22PWB-R  CONN_FFC_1X22_SH_0.5MM_SM_RA_0.5K-GX-22PWB-R  [CONN_FFC_1X22_0.5MM_SM_RA_0.5K-GX-22PWB-R]
L2  2.2uH 2.84A  IND_3MM_SQ_2.2UH_2.84A_1.2MM_HEIGHT  [IND_3MM_SQ_1.2MM_HEIGHT]
MNT1  MOUNTHOLE_M2.5_4.8MM_PAD  [MOUNTHOLE_M2.5_4.8MM_PAD]
MNT2  MOUNTHOLE_M2.5_4.8MM_PAD  [MOUNTHOLE_M2.5_4.8MM_PAD]
MNT3  MOUNTHOLE_M2.5_4.8MM_PAD  [MOUNTHOLE_M2.5_4.8MM_PAD]
MNT4  MOUNTHOLE_M2.5_4.8MM_PAD  [MOUNTHOLE_M2.5_4.8MM_PAD]
R3  0Ω 1%  RES_0402_0R_1%  [RES_0402]
R5  110kΩ 1%  RES_0402_110K_1%  [RES_0402]
R8  120kΩ 1%  RES_0402_120K_1%  [RES_0402]
R9  10kΩ 1%  RES_0402_10K_1%_1/16W  [RES_0402]
R10  100kΩ 1%  RES_0402_100K_1%_1/16W  [RES_0402]
R66  1MΩ 1%  RES_0402_1M_1%  [RES_0402]
TP5  TESTPOINT_1MM  [TEST_POINT_1MM]
TP6  TESTPOINT_1MM  [TEST_POINT_1MM]
TP7  TESTPOINT_1MM  [TEST_POINT_1MM]
TP8  TESTPOINT_1MM  [TEST_POINT_1MM]
TP9  TESTPOINT_1MM  [TEST_POINT_1MM]
TP10  TESTPOINT_1MM  [TEST_POINT_1MM]
U2  SY8089A1AAC  SY8089A1AAC_SY8089A1AAC  [SOT95P285X110-5N]

### Nets
CGND: MNT3.P$1 MNT4.P$1 ; supply symbol labelled CHASSIS ; also sheet 4
GND: C1.2 C2.2 C6.1 C7.1 C8.1 C11.1 C12.1 C14.1 C16.1 C17.1 C35.2 C36.1 C52.2 C53.1 J1.4 J1.7 J1.10 J1.13 J1.16 J1.19 J1.22 J1.23(SH) J1.24(SH) J2.3 J6.4 J6.7 J6.10 J6.13 J6.16 J6.19 J6.22 J6.23(SH) J6.24(SH) R8.2 R10.2 R66.2 TP9.P$1 TP10.P$1 U2.2(GND) ; also sheet 4,5
HDMIRX_DETN: J6.5 ; also sheet 4,5
I2C_SCL_3V3: J1.3 ; also sheet 5
I2C_SDA_3V3: J1.2 ; also sheet 5
I2S_HDMI_LRCK [50 ohm]: J2.4 ; also sheet 5
I2S_HDMI_MCLK [50 ohm]: J2.5 ; also sheet 5
I2S_HDMI_SCLK [50 ohm]: J2.2 ; also sheet 5
I2S_HDMI_SDI [50 ohm]: J2.1 ; also sheet 5
MIPI-CSI0-CK_N [hdmi_diff]: J6.15 ; also sheet 5
MIPI-CSI0-CK_P [hdmi_diff]: J6.14 ; also sheet 5
MIPI-CSI0-D0_N [hdmi_diff]: J6.21 ; also sheet 5
MIPI-CSI0-D0_P [hdmi_diff]: J6.20 ; also sheet 5
MIPI-CSI0-D1_N [hdmi_diff]: J6.18 ; also sheet 5
MIPI-CSI0-D1_P [hdmi_diff]: J6.17 ; also sheet 5
MIPI-CSI0-D2_N [hdmi_diff]: J6.12 ; also sheet 5
MIPI-CSI0-D2_P [hdmi_diff]: J6.11 ; also sheet 5
MIPI-CSI0-D3_N [hdmi_diff]: J6.9 ; also sheet 5
MIPI-CSI0-D3_P [hdmi_diff]: J6.8 ; also sheet 5
MIPI-CSI1-CK_N [hdmi_diff]: J1.15 ; also sheet 5
MIPI-CSI1-CK_P [hdmi_diff]: J1.14 ; also sheet 5
MIPI-CSI1-D0_N [hdmi_diff]: J1.21 ; also sheet 5
MIPI-CSI1-D0_P [hdmi_diff]: J1.20 ; also sheet 5
MIPI-CSI1-D1_N [hdmi_diff]: J1.18 ; also sheet 5
MIPI-CSI1-D1_P [hdmi_diff]: J1.17 ; also sheet 5
MIPI-CSI1-D2_N [hdmi_diff]: J1.12 ; also sheet 5
MIPI-CSI1-D2_P [hdmi_diff]: J1.11 ; also sheet 5
MIPI-CSI1-D3_N [hdmi_diff]: J1.9 ; also sheet 5
MIPI-CSI1-D3_P [hdmi_diff]: J1.8 ; also sheet 5
N$4: J6.1 R3.1 TP8.P$1
N$23: L2.1 U2.3(LX)
N$26: C53.2 MNT1.P$1 R66.1
N$120: C10.1 R5.2 R8.1 U2.5(FB)
N$157: R9.1 R10.1 U2.1(EN)
RK628_INTN_3V3: J1.5 ; also sheet 5
RK628_RSTN_3V3: J1.6 ; also sheet 5
VCC1V1_RK628: C10.2 C11.2 C14.2 FB1.1 L2.2 R5.1 ; also sheet 5
VCC_3V3: C1.1 C2.1 C7.2 C8.2 C12.2 C35.1 C52.1 FB3.1 J1.1 R3.2 R9.2 TP7.P$1 U2.4(IN) ; also sheet 4,5
VCCA1V1_RK628: C16.2 C17.2 FB1.2 TP6.P$1 ; also sheet 5
VCCA3V3_RK628: C6.2 C36.2 FB3.2 TP5.P$1 ; also sheet 5
Unconnected: J6.2 J6.3 J6.6 MNT2.P$1

### Notes on the sheet
- POWER | MIPI Interfaces
- Mountholes
- I2S Audio 
  Header

## Power pins joined to a net without a drawn wire
HDMITX_AVDD_3V3: U3.K4(HDMITX_AVDD_3V3)
HDMITX_DVDD_1V1: U3.J4(HDMITX_DVDD_1V1)
HDMITX_DVDD_1V1_2: U3.J5(HDMITX_DVDD_1V1_2)
HDMITX_DVDD_1V1_3: U3.J6(HDMITX_DVDD_1V1_3)
VCCIO2_1: U3.E8(VCCIO2_1)
VCCIO2_2: U3.F8(VCCIO2_2)

## Library data of the parts
C1 C5 C8 C14 C16 C18-C20 C25 C27 C29-C32 C34-C36 C53 CH1 = !GPLIB_PASSIVE:CAP_0402; JLCPCB: C1525; JLC_PARTS_TYPE: BASIC; MF: Samsung Electro-Mechanics; MP: CL05B104KO5NNNC
C2 C6 C12 C17 C23 C26 C28 C33 C52 = !GPLIB_PASSIVE:CAP_0402; JLCPCB: C315248; MF: Samsung Electro-Mechanics; MP: CL05A106MP5NUNC
C7 C11 = !GPLIB_PASSIVE:CAP_0603; JLCPCB: C7432770; MF: Chinocera; MP: HGC0603R5226M100NTHJ
C10 = !GPLIB_PASSIVE:CAP_0402; JLCPCB: C106200; MF: YAGEO; MP: CC0402JRNPO9BN101
C13 C15 = !GPLIB_PASSIVE:CAP_0402; JLCPCB: C1562; MF: FH (Guangdong Fenghua Advanced Tech); MP: 0402CG330J500NT
C21 C24 = !GPLIB_PASSIVE:CAP_0201
C22 = !GPLIB_PASSIVE:CAP_0402; JLCPCB: C52923; JLC_PARTS_TYPE: Basic; MF: Samsung Electro-Mechanics; MP: CL05A105KA5NQNC
D2 D3 = !GPLIB_ACTIVE:DIODE_SCHOTTKY; JLCPCB: C8590
ED1-ED4 = !GPLIB_ACTIVE:TVS_ESD_1CH_BI; JLCPCB: C2892490; MF: KUU; MP: KLXES15AAA1
FB1 FB3 = !GPLIB_PASSIVE:FERRITE_0603; JLCPCB: C14709; JLC_FOOTPRINT: TRUE; JLC_PARTS_TYPE: Basic; MF: Murata Electronics; MP: BLM18PG121SN1D
J1 J6 = !GPLIB_CONN:CONN_FFC_1X22_SH; JLCPCB: C53223210; MF: GUOCONN; MP: 0.5K-GX-22PWB-R
J2 = !GPLIB_CONN:HDR_1X05; JLC-ROTATION: 0; JLC-X-OFFSET: 5.08; JLC-Y-OFFSET: 0; JLCPCB: C2932699
J4 = !GPLIB_CONN:CONN_HDMI_A; JLC-Y-OFFSET: 2.75; JLCPCB: C7501811; MF: Hong Cheng; MP: HC-HDMI0019T-4
L2 = !GPLIB_PASSIVE:IND_3MM_SQ; JLCPCB: C404494; MF: TDK; MP: VLS3012HBX-2R2M
L3-L6 = groundplane:BCMF062P120T
MNT1-MNT4 = !GPLIB_PCB:MOUNTHOLE
Q7 = !GPLIB_ACTIVE:NPN; JLCPCB: C2146; MF: Jiangsu Changjing Electronics Technology Co., Ltd.; MP: S8050 J3Y(RANGE:200-350)
R1 R48 = !GPLIB_PASSIVE:RES_0402; JLCPCB: C25879; JLC_PARTS_TYPE: Basic
R2 = !GPLIB_PASSIVE:RES_0402; JLCPCB: C25879; JLC_PARTS_TYPE: Basic; MF: UNI-ROYAL(Uniroyal Elec); MP: 0402WGF2201TCE
R3 = !GPLIB_PASSIVE:RES_0402; JLCPCB: C17168; JLC_PARTS_TYPE: Basic; MF: UNI-ROYAL(Uniroyal Elec); MP: 0402WGF0000TCE
R5 = !GPLIB_PASSIVE:RES_0402; JLCPCB: C2909311; MF: FOJAN; MP: FRC0402F1103TS
R6 R32 R33 R36 R37 = !GPLIB_PASSIVE:RES_0402; JLCPCB: C25092; JLC_PARTS_TYPE: Basic; MF: UNI-ROYAL(Uniroyal Elec); MP: 0402WGF220JTCE
R8 = !GPLIB_PASSIVE:RES_0402; JLCPCB: C2909314; MF: FOJAN; MP: FRC0402F1203TS
R9 R12 R21 R23 R56 R58 = !GPLIB_PASSIVE:RES_0402; JLCPCB: C2906861; MF: FOJAN; MP: FRC0402F1002TS
R10 R29 = !GPLIB_PASSIVE:RES_0402; JLCPCB: C25741; JLC_PARTS_TYPE: Basic; MF: UNI-ROYAL(Uniroyal Elec); MP: 0402WGF1003TCE
R11 = !GPLIB_PASSIVE:RES_0402; JLCPCB: C324800; MF: FH (Guangdong Fenghua Advanced Tech); MP: RC-02K4021FT
R13-R20 = !GPLIB_PASSIVE:RES_0201; JLCPCB: C270323; MF: UNI-ROYAL(Uniroyal Elec); MP: 0201WMJ022JTEE
R22 R66 = !GPLIB_PASSIVE:RES_0402; JLCPCB: C26083; JLC_PARTS_TYPE: Basic; MF: UNI-ROYAL(Uniroyal Elec); MP: 0402WGF1004TCE
R24 R30 R31 R35 = !GPLIB_PASSIVE:RES_0402; JLCPCB: C25076; JLC_PARTS_TYPE: Basic; MF: UNI-ROYAL(Uniroyal Elec); MP: 0402WGF1000TCE
R25 = !GPLIB_PASSIVE:RES_0402; JLCPCB: C138022; MF: YAGEO; MP: RC0402FR-0727KL
R26 R27 R34 = !GPLIB_PASSIVE:RES_0402; JLCPCB: C4109; JLC_PARTS_TYPE: Basic; MF: UNI-ROYAL(Uniroyal Elec); MP: 0402WGF2001TCE
R28 = !GPLIB_PASSIVE:RES_0402; JLCPCB: C106235; MF: YAGEO; MP: RC0402FR-071KL
R40-R43 = !GPLIB_PASSIVE:RES_0402; JLCPCB: C25105; JLC_PARTS_TYPE: Basic; MF: UNI-ROYAL(Uniroyal Elec); MP: 0402WGF330JTCE
TP1-TP15 = !GPLIB_PCB:TESTPOINT
U2 = groundplane:SY8089A1AAC; JLC-ROTATION: 180; JLC-X-OFFSET: 0; JLC-Y-OFFSET: 0; JLCPCB: C479074; MF: Silergy Corp; MP: SY8089A1AAC
U3 = !GPLIB_ACTIVE:IF_VIDEO_BRIDGE_RK628F/H; JLCPCB: C45369093; MF: Rockchip; MP: RK628H
U4 U5 = !GPLIB_ACTIVE:TVS_ESD_4CH_10P_PASS_THRU: ESD and Surge protection diodes TVS 4 line bi-directional DFN2510-10; JLCPCB: C42375217; JLC_FOOTPRINT: TRUE; MF: KUU; MP: BTRD10A03
Y5 = groundplane:CRYSTAL_SMD2016-4P; JLCPCB: C20885025; MF: Yajingxin; MP: T201624MLBDE2X

## Net classes
4 hdmi_diff: width 0.113 mm